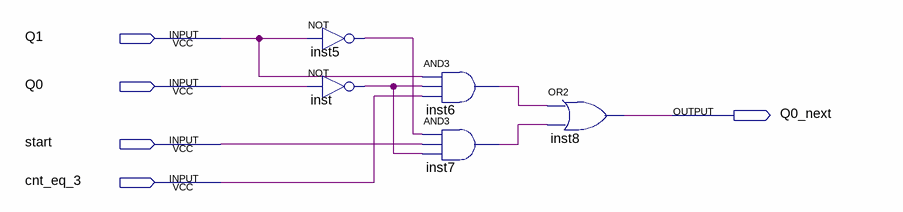
[diagram p0: schematic sheet]
// Quartus schematic Q0_next.bdf as structural Verilog: 5 symbols, 5 pins
module Q0_next (
  input  Q1,
  input  Q0,
  input  start,
  input  cnt_eq_3,
  output Q0_next
);

  wire inst5_out, inst6_out, inst7_out, inst_out;

  not inst5 (inst5_out, Q1);
  not inst (inst_out, Q0);
  and inst6 (inst6_out, Q1, inst_out, cnt_eq_3);
  and inst7 (inst7_out, inst5_out, start, inst_out);
  or inst8 (Q0_next, inst6_out, inst7_out);
endmodule
